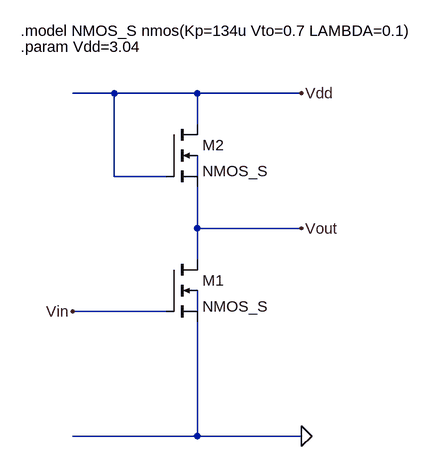
[diagram p0: schematic Exercise2.asc]
Exercise2.asc, the LTspice schematic file:
Version 4.1
SHEET 1 880 680
WIRE 112 -32 48 -32
WIRE 240 -32 112 -32
WIRE 400 -32 240 -32
WIRE 240 16 240 -32
WIRE 112 96 112 -32
WIRE 192 96 112 96
WIRE 240 96 240 64
WIRE 240 176 240 112
WIRE 400 176 240 176
WIRE 240 224 240 176
WIRE 192 304 48 304
WIRE 240 304 240 272
WIRE 240 496 240 320
WIRE 240 496 48 496
WIRE 400 496 240 496
FLAG 400 -32 Vdd
FLAG 400 176 Vout
FLAG 48 304 Vin
FLAG 400 496 0
SYMBOL nmos4 192 224 R0
SYMATTR InstName M1
SYMATTR Value NMOS_S
SYMBOL nmos4 192 16 R0
SYMATTR InstName M2
SYMATTR Value NMOS_S
TEXT -32 -128 Left 2 !.model NMOS_S nmos(Kp=134u Vto=0.7 LAMBDA=0.1)
TEXT -32 -104 Left 2 !.param Vdd=3.04

The netlist it stands for:
* Exercise2.asc
M1 Vout Vin 0 N002 NMOS_S
M2 Vdd Vdd Vout N001 NMOS_S
.model NMOS NMOS
.model PMOS PMOS
.lib standard.mos
.model NMOS_S nmos(Kp=134u Vto=0.7 LAMBDA=0.1)
.param Vdd=3.04
.backanno
.end